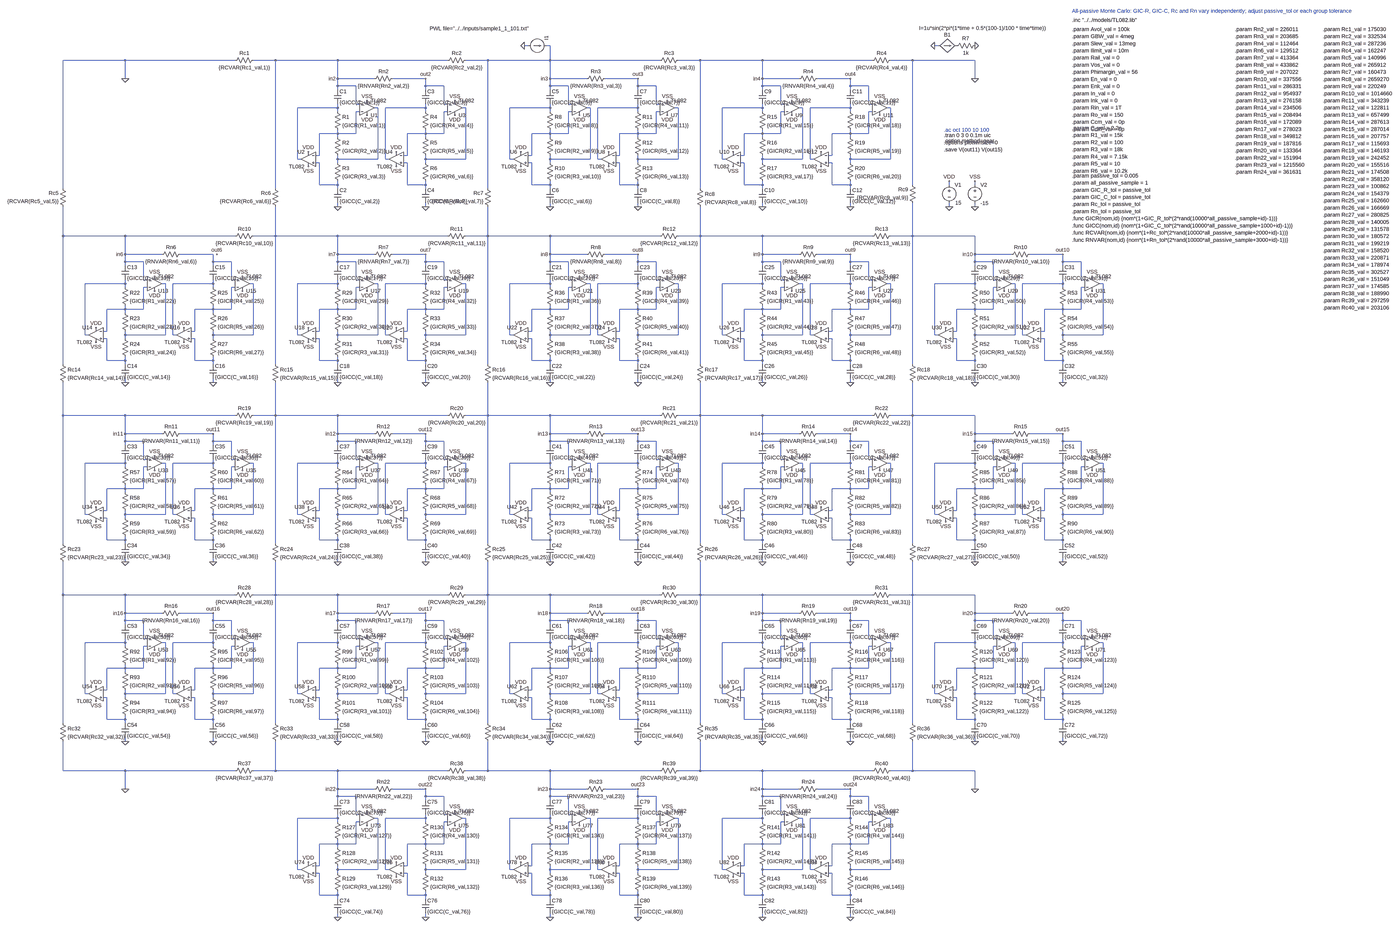
[diagram p0: schematic ALL.asc, whole sheet]
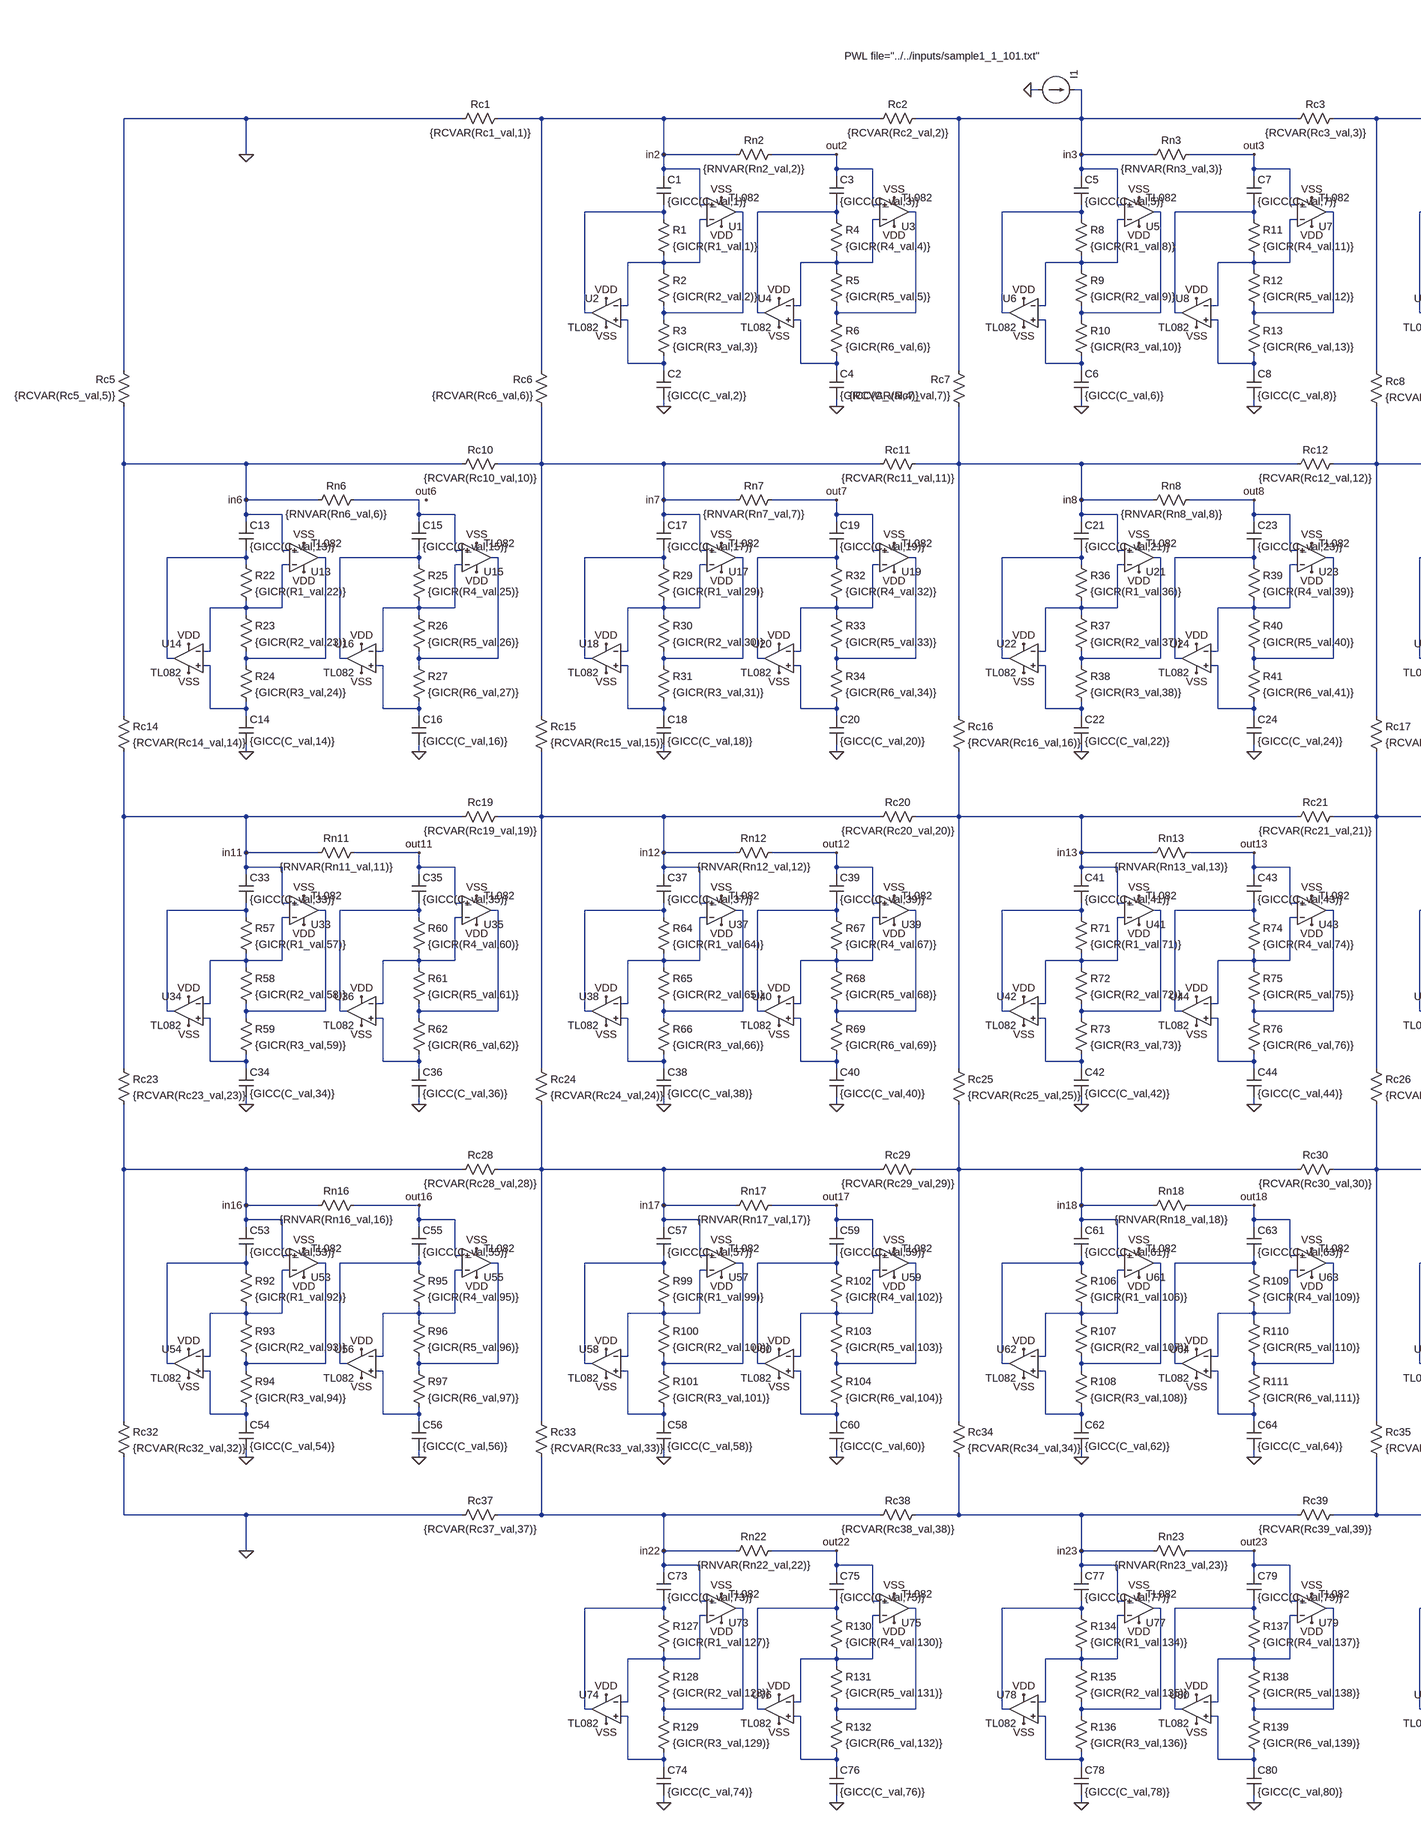
[diagram p1: schematic ALL.asc, part, row 1 of 1, column 1 of 2]
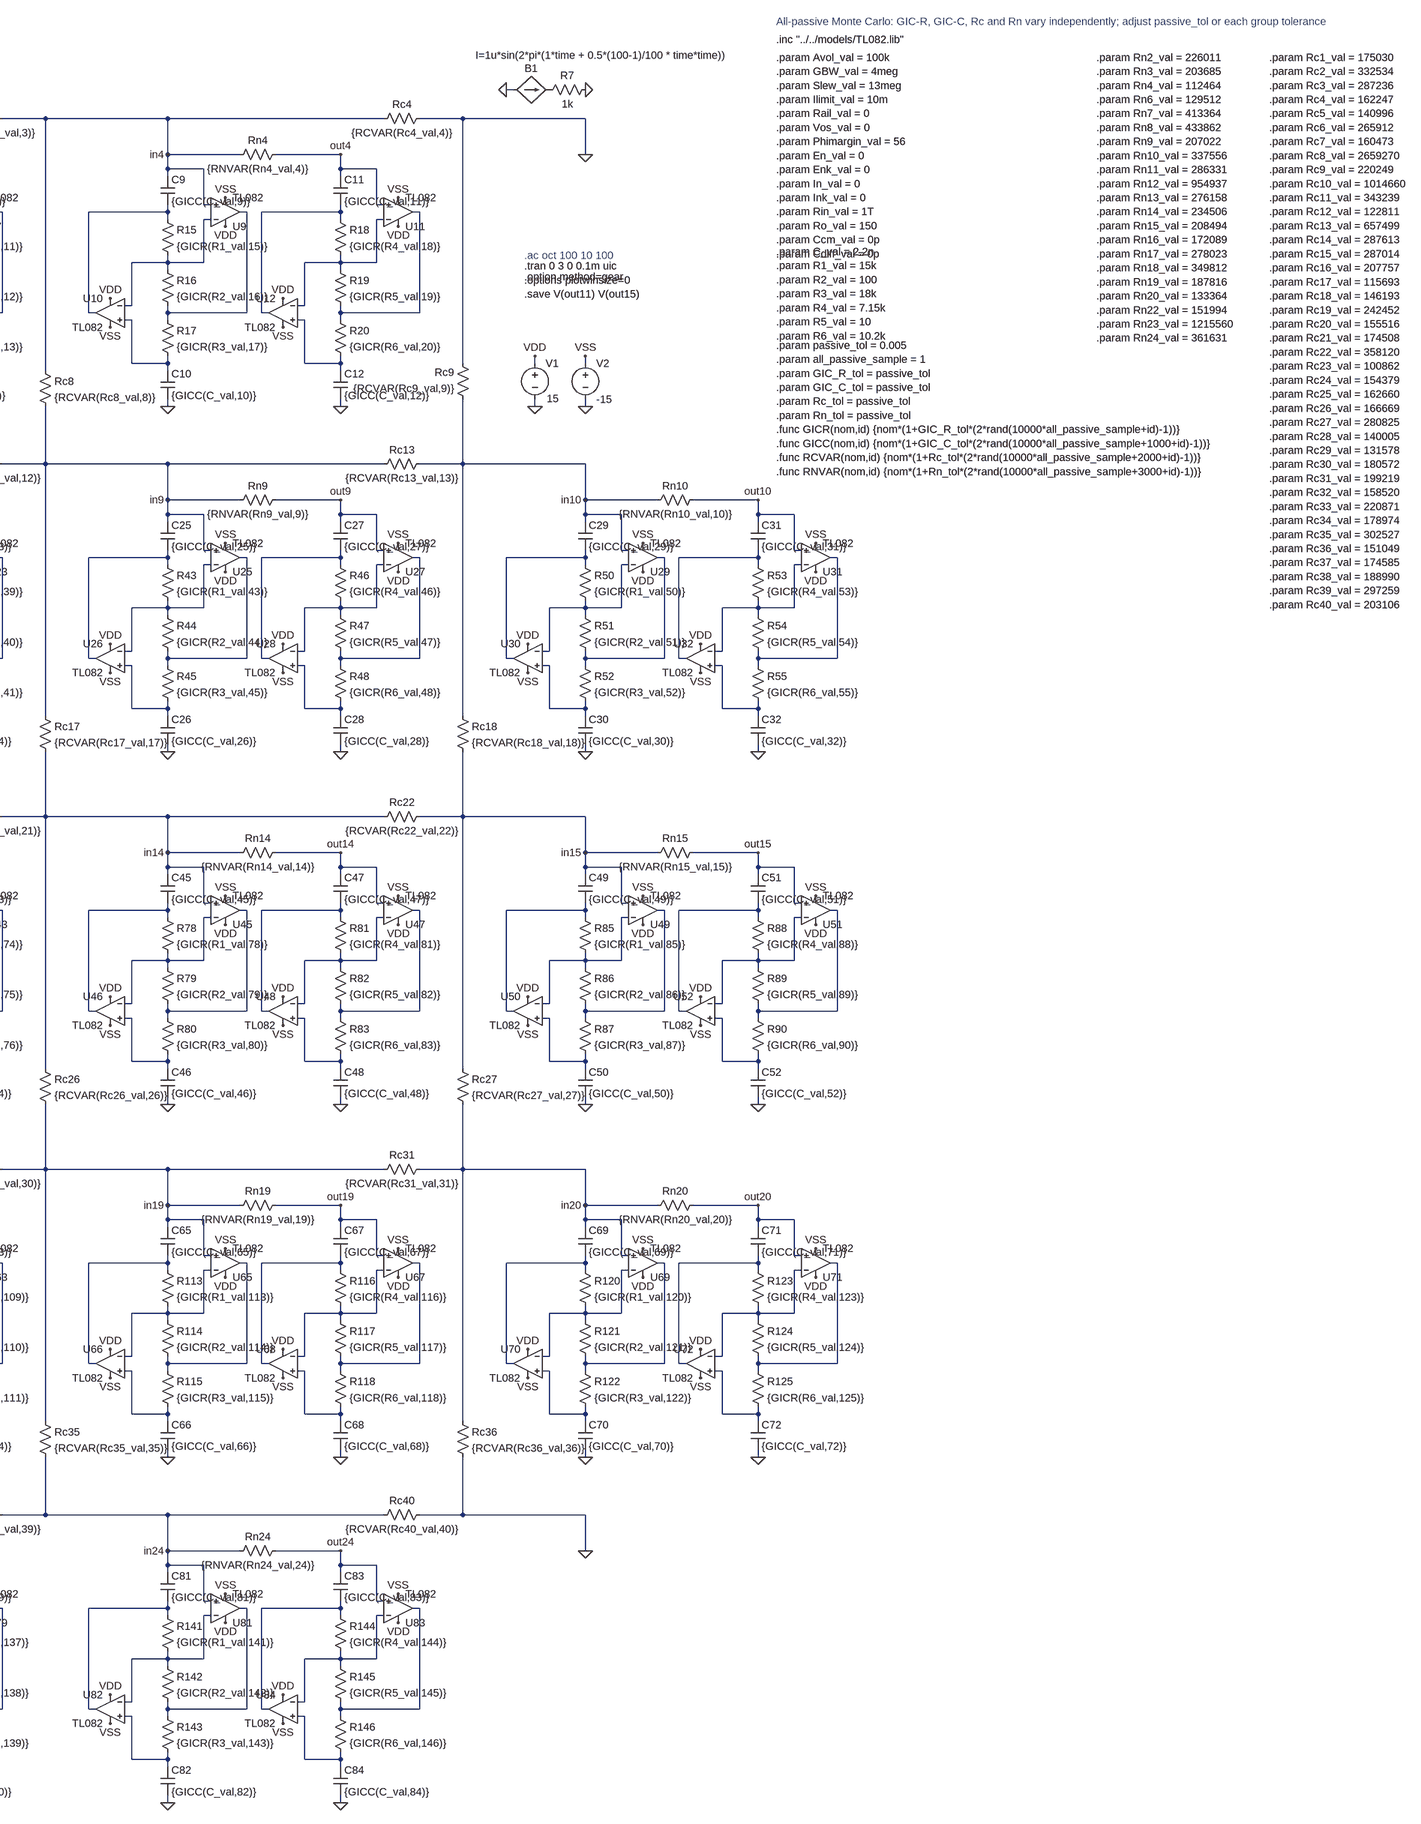
[diagram p2: schematic ALL.asc, part, row 1 of 1, column 2 of 2]
* ALL.asc
V1 VDD 0 15
V2 VSS 0 -15
C1 in2 N001 {GICC(C_val,1)}
R1 N001 N013 {GICR(R1_val,1)}
R2 N013 N002 {GICR(R2_val,2)}
R3 N002 N019 {GICR(R3_val,3)}
C2 N019 0 {GICC(C_val,2)}
C3 out2 N003 {GICC(C_val,3)}
R4 N003 N014 {GICR(R4_val,4)}
R5 N014 N004 {GICR(R5_val,5)}
R6 N004 N020 {GICR(R6_val,6)}
C4 N020 0 {GICC(C_val,4)}
Rn2 out2 in2 {RNVAR(Rn2_val,2)}
C5 in3 N005 {GICC(C_val,5)}
R8 N005 N015 {GICR(R1_val,8)}
R9 N015 N006 {GICR(R2_val,9)}
R10 N006 N021 {GICR(R3_val,10)}
C6 N021 0 {GICC(C_val,6)}
C7 out3 N007 {GICC(C_val,7)}
R11 N007 N016 {GICR(R4_val,11)}
R12 N016 N008 {GICR(R5_val,12)}
R13 N008 N022 {GICR(R6_val,13)}
C8 N022 0 {GICC(C_val,8)}
Rn3 out3 in3 {RNVAR(Rn3_val,3)}
C9 in4 N009 {GICC(C_val,9)}
R15 N009 N017 {GICR(R1_val,15)}
R16 N017 N010 {GICR(R2_val,16)}
R17 N010 N023 {GICR(R3_val,17)}
C10 N023 0 {GICC(C_val,10)}
C11 out4 N011 {GICC(C_val,11)}
R18 N011 N018 {GICR(R4_val,18)}
R19 N018 N012 {GICR(R5_val,19)}
R20 N012 N024 {GICR(R6_val,20)}
C12 N024 0 {GICC(C_val,12)}
Rn4 out4 in4 {RNVAR(Rn4_val,4)}
C13 in6 N026 {GICC(C_val,13)}
R22 N026 N046 {GICR(R1_val,22)}
R23 N046 N027 {GICR(R2_val,23)}
R24 N027 N056 {GICR(R3_val,24)}
C14 N056 0 {GICC(C_val,14)}
C15 N025 N028 {GICC(C_val,15)}
R25 N028 N047 {GICR(R4_val,25)}
R26 N047 N029 {GICR(R5_val,26)}
R27 N029 N057 {GICR(R6_val,27)}
C16 N057 0 {GICC(C_val,16)}
Rn6 N025 in6 {RNVAR(Rn6_val,6)}
C17 in7 N030 {GICC(C_val,17)}
R29 N030 N048 {GICR(R1_val,29)}
R30 N048 N031 {GICR(R2_val,30)}
R31 N031 N058 {GICR(R3_val,31)}
C18 N058 0 {GICC(C_val,18)}
C19 out7 N032 {GICC(C_val,19)}
R32 N032 N049 {GICR(R4_val,32)}
R33 N049 N033 {GICR(R5_val,33)}
R34 N033 N059 {GICR(R6_val,34)}
C20 N059 0 {GICC(C_val,20)}
Rn7 out7 in7 {RNVAR(Rn7_val,7)}
C21 in8 N034 {GICC(C_val,21)}
R36 N034 N050 {GICR(R1_val,36)}
R37 N050 N035 {GICR(R2_val,37)}
R38 N035 N060 {GICR(R3_val,38)}
C22 N060 0 {GICC(C_val,22)}
C23 out8 N036 {GICC(C_val,23)}
R39 N036 N051 {GICR(R4_val,39)}
R40 N051 N037 {GICR(R5_val,40)}
R41 N037 N061 {GICR(R6_val,41)}
C24 N061 0 {GICC(C_val,24)}
Rn8 out8 in8 {RNVAR(Rn8_val,8)}
C25 in9 N038 {GICC(C_val,25)}
R43 N038 N052 {GICR(R1_val,43)}
R44 N052 N039 {GICR(R2_val,44)}
R45 N039 N062 {GICR(R3_val,45)}
C26 N062 0 {GICC(C_val,26)}
C27 out9 N040 {GICC(C_val,27)}
R46 N040 N053 {GICR(R4_val,46)}
R47 N053 N041 {GICR(R5_val,47)}
R48 N041 N063 {GICR(R6_val,48)}
C28 N063 0 {GICC(C_val,28)}
Rn9 out9 in9 {RNVAR(Rn9_val,9)}
C29 in10 N042 {GICC(C_val,29)}
R50 N042 N054 {GICR(R1_val,50)}
R51 N054 N043 {GICR(R2_val,51)}
R52 N043 N064 {GICR(R3_val,52)}
C30 N064 0 {GICC(C_val,30)}
C31 out10 N044 {GICC(C_val,31)}
R53 N044 N055 {GICR(R4_val,53)}
R54 N055 N045 {GICR(R5_val,54)}
R55 N045 N065 {GICR(R6_val,55)}
C32 N065 0 {GICC(C_val,32)}
Rn10 out10 in10 {RNVAR(Rn10_val,10)}
C33 in11 N066 {GICC(C_val,33)}
R57 N066 N086 {GICR(R1_val,57)}
R58 N086 N067 {GICR(R2_val,58)}
R59 N067 N096 {GICR(R3_val,59)}
C34 N096 0 {GICC(C_val,34)}
C35 out11 N068 {GICC(C_val,35)}
R60 N068 N087 {GICR(R4_val,60)}
R61 N087 N069 {GICR(R5_val,61)}
R62 N069 N097 {GICR(R6_val,62)}
C36 N097 0 {GICC(C_val,36)}
Rn11 out11 in11 {RNVAR(Rn11_val,11)}
C37 in12 N070 {GICC(C_val,37)}
R64 N070 N088 {GICR(R1_val,64)}
R65 N088 N071 {GICR(R2_val,65)}
R66 N071 N098 {GICR(R3_val,66)}
C38 N098 0 {GICC(C_val,38)}
C39 out12 N072 {GICC(C_val,39)}
R67 N072 N089 {GICR(R4_val,67)}
R68 N089 N073 {GICR(R5_val,68)}
R69 N073 N099 {GICR(R6_val,69)}
C40 N099 0 {GICC(C_val,40)}
Rn12 out12 in12 {RNVAR(Rn12_val,12)}
C41 in13 N074 {GICC(C_val,41)}
R71 N074 N090 {GICR(R1_val,71)}
R72 N090 N075 {GICR(R2_val,72)}
R73 N075 N100 {GICR(R3_val,73)}
C42 N100 0 {GICC(C_val,42)}
C43 out13 N076 {GICC(C_val,43)}
R74 N076 N091 {GICR(R4_val,74)}
R75 N091 N077 {GICR(R5_val,75)}
R76 N077 N101 {GICR(R6_val,76)}
C44 N101 0 {GICC(C_val,44)}
Rn13 out13 in13 {RNVAR(Rn13_val,13)}
C45 in14 N078 {GICC(C_val,45)}
R78 N078 N092 {GICR(R1_val,78)}
R79 N092 N079 {GICR(R2_val,79)}
R80 N079 N102 {GICR(R3_val,80)}
C46 N102 0 {GICC(C_val,46)}
C47 out14 N080 {GICC(C_val,47)}
R81 N080 N093 {GICR(R4_val,81)}
R82 N093 N081 {GICR(R5_val,82)}
R83 N081 N103 {GICR(R6_val,83)}
C48 N103 0 {GICC(C_val,48)}
Rn14 out14 in14 {RNVAR(Rn14_val,14)}
C49 in15 N082 {GICC(C_val,49)}
R85 N082 N094 {GICR(R1_val,85)}
R86 N094 N083 {GICR(R2_val,86)}
R87 N083 N104 {GICR(R3_val,87)}
C50 N104 0 {GICC(C_val,50)}
C51 out15 N084 {GICC(C_val,51)}
R88 N084 N095 {GICR(R4_val,88)}
R89 N095 N085 {GICR(R5_val,89)}
R90 N085 N105 {GICR(R6_val,90)}
C52 N105 0 {GICC(C_val,52)}
Rn15 out15 in15 {RNVAR(Rn15_val,15)}
C53 in16 N106 {GICC(C_val,53)}
R92 N106 N126 {GICR(R1_val,92)}
R93 N126 N107 {GICR(R2_val,93)}
R94 N107 N136 {GICR(R3_val,94)}
C54 N136 0 {GICC(C_val,54)}
C55 out16 N108 {GICC(C_val,55)}
R95 N108 N127 {GICR(R4_val,95)}
R96 N127 N109 {GICR(R5_val,96)}
R97 N109 N137 {GICR(R6_val,97)}
C56 N137 0 {GICC(C_val,56)}
Rn16 out16 in16 {RNVAR(Rn16_val,16)}
C57 in17 N110 {GICC(C_val,57)}
R99 N110 N128 {GICR(R1_val,99)}
R100 N128 N111 {GICR(R2_val,100)}
R101 N111 N138 {GICR(R3_val,101)}
C58 N138 0 {GICC(C_val,58)}
C59 out17 N112 {GICC(C_val,59)}
R102 N112 N129 {GICR(R4_val,102)}
R103 N129 N113 {GICR(R5_val,103)}
R104 N113 N139 {GICR(R6_val,104)}
C60 N139 0 {GICC(C_val,60)}
Rn17 out17 in17 {RNVAR(Rn17_val,17)}
C61 in18 N114 {GICC(C_val,61)}
R106 N114 N130 {GICR(R1_val,106)}
R107 N130 N115 {GICR(R2_val,107)}
R108 N115 N140 {GICR(R3_val,108)}
C62 N140 0 {GICC(C_val,62)}
C63 out18 N116 {GICC(C_val,63)}
R109 N116 N131 {GICR(R4_val,109)}
R110 N131 N117 {GICR(R5_val,110)}
R111 N117 N141 {GICR(R6_val,111)}
C64 N141 0 {GICC(C_val,64)}
Rn18 out18 in18 {RNVAR(Rn18_val,18)}
C65 in19 N118 {GICC(C_val,65)}
R113 N118 N132 {GICR(R1_val,113)}
R114 N132 N119 {GICR(R2_val,114)}
R115 N119 N142 {GICR(R3_val,115)}
C66 N142 0 {GICC(C_val,66)}
C67 out19 N120 {GICC(C_val,67)}
R116 N120 N133 {GICR(R4_val,116)}
R117 N133 N121 {GICR(R5_val,117)}
R118 N121 N143 {GICR(R6_val,118)}
C68 N143 0 {GICC(C_val,68)}
Rn19 out19 in19 {RNVAR(Rn19_val,19)}
C69 in20 N122 {GICC(C_val,69)}
R120 N122 N134 {GICR(R1_val,120)}
R121 N134 N123 {GICR(R2_val,121)}
R122 N123 N144 {GICR(R3_val,122)}
C70 N144 0 {GICC(C_val,70)}
C71 out20 N124 {GICC(C_val,71)}
R123 N124 N135 {GICR(R4_val,123)}
R124 N135 N125 {GICR(R5_val,124)}
R125 N125 N145 {GICR(R6_val,125)}
C72 N145 0 {GICC(C_val,72)}
Rn20 out20 in20 {RNVAR(Rn20_val,20)}
C73 in22 N146 {GICC(C_val,73)}
R127 N146 N158 {GICR(R1_val,127)}
R128 N158 N147 {GICR(R2_val,128)}
R129 N147 N164 {GICR(R3_val,129)}
C74 N164 0 {GICC(C_val,74)}
C75 out22 N148 {GICC(C_val,75)}
R130 N148 N159 {GICR(R4_val,130)}
R131 N159 N149 {GICR(R5_val,131)}
R132 N149 N165 {GICR(R6_val,132)}
C76 N165 0 {GICC(C_val,76)}
Rn22 out22 in22 {RNVAR(Rn22_val,22)}
C77 in23 N150 {GICC(C_val,77)}
R134 N150 N160 {GICR(R1_val,134)}
R135 N160 N151 {GICR(R2_val,135)}
R136 N151 N166 {GICR(R3_val,136)}
C78 N166 0 {GICC(C_val,78)}
C79 out23 N152 {GICC(C_val,79)}
R137 N152 N161 {GICR(R4_val,137)}
R138 N161 N153 {GICR(R5_val,138)}
R139 N153 N167 {GICR(R6_val,139)}
C80 N167 0 {GICC(C_val,80)}
Rn23 out23 in23 {RNVAR(Rn23_val,23)}
C81 in24 N154 {GICC(C_val,81)}
R141 N154 N162 {GICR(R1_val,141)}
R142 N162 N155 {GICR(R2_val,142)}
R143 N155 N168 {GICR(R3_val,143)}
C82 N168 0 {GICC(C_val,82)}
C83 out24 N156 {GICC(C_val,83)}
R144 N156 N163 {GICR(R4_val,144)}
R145 N163 N157 {GICR(R5_val,145)}
R146 N157 N169 {GICR(R6_val,146)}
C84 N169 0 {GICC(C_val,84)}
Rn24 out24 in24 {RNVAR(Rn24_val,24)}
Rc2 in3 in2 {RCVAR(Rc2_val,2)}
Rc3 in4 in3 {RCVAR(Rc3_val,3)}
Rc6 in7 in2 {RCVAR(Rc6_val,6)}
Rc7 in8 in3 {RCVAR(Rc7_val,7)}
Rc11 in7 in8 {RCVAR(Rc11_val,11)}
Rc12 in8 in9 {RCVAR(Rc12_val,12)}
Rc13 in9 in10 {RCVAR(Rc13_val,13)}
Rc14 in6 in11 {RCVAR(Rc14_val,14)}
Rc15 in7 in12 {RCVAR(Rc15_val,15)}
Rc16 in8 in13 {RCVAR(Rc16_val,16)}
Rc18 in10 in15 {RCVAR(Rc18_val,18)}
Rc21 in14 in13 {RCVAR(Rc21_val,21)}
Rc22 in15 in14 {RCVAR(Rc22_val,22)}
Rc23 in11 in16 {RCVAR(Rc23_val,23)}
Rc24 in12 in17 {RCVAR(Rc24_val,24)}
Rc25 in13 in18 {RCVAR(Rc25_val,25)}
Rc26 in14 in19 {RCVAR(Rc26_val,26)}
Rc27 in15 in20 {RCVAR(Rc27_val,27)}
Rc28 in17 in16 {RCVAR(Rc28_val,28)}
Rc30 in19 in18 {RCVAR(Rc30_val,30)}
Rc32 in16 0 {RCVAR(Rc32_val,32)}
Rc33 in17 in22 {RCVAR(Rc33_val,33)}
Rc34 in18 in23 {RCVAR(Rc34_val,34)}
Rc35 in19 in24 {RCVAR(Rc35_val,35)}
Rc36 in20 0 {RCVAR(Rc36_val,36)}
Rc1 in2 0 {RCVAR(Rc1_val,1)}
Rc5 in6 0 {RCVAR(Rc5_val,5)}
Rc9 in10 0 {RCVAR(Rc9_val,9)}
Rc4 in4 0 {RCVAR(Rc4_val,4)}
Rc37 in22 0 {RCVAR(Rc37_val,37)}
Rc38 in23 in22 {RCVAR(Rc38_val,38)}
Rc39 in24 in23 {RCVAR(Rc39_val,39)}
Rc40 0 in24 {RCVAR(Rc40_val,40)}
R7 0 P001 1k
B1 0 P001 I=1u*sin(2*pi*(1*time + 0.5*(100-1)/100 * time*time))
I1 0 in3 PWL file="../../inputs/sample1_1_101.txt"
X§U1 in2 N013 VDD VSS N002 TL082  ; pins In+ In- V+ V- OUT
X§U2 N019 N013 VDD VSS N001 TL082  ; pins In+ In- V+ V- OUT
X§U3 out2 N014 VDD VSS N004 TL082  ; pins In+ In- V+ V- OUT
X§U4 N020 N014 VDD VSS N003 TL082  ; pins In+ In- V+ V- OUT
X§U5 in3 N015 VDD VSS N006 TL082  ; pins In+ In- V+ V- OUT
X§U6 N021 N015 VDD VSS N005 TL082  ; pins In+ In- V+ V- OUT
X§U7 out3 N016 VDD VSS N008 TL082  ; pins In+ In- V+ V- OUT
X§U8 N022 N016 VDD VSS N007 TL082  ; pins In+ In- V+ V- OUT
X§U9 in4 N017 VDD VSS N010 TL082  ; pins In+ In- V+ V- OUT
X§U10 N023 N017 VDD VSS N009 TL082  ; pins In+ In- V+ V- OUT
X§U11 out4 N018 VDD VSS N012 TL082  ; pins In+ In- V+ V- OUT
X§U12 N024 N018 VDD VSS N011 TL082  ; pins In+ In- V+ V- OUT
X§U13 in6 N046 VDD VSS N027 TL082  ; pins In+ In- V+ V- OUT
X§U14 N056 N046 VDD VSS N026 TL082  ; pins In+ In- V+ V- OUT
X§U15 N025 N047 VDD VSS N029 TL082  ; pins In+ In- V+ V- OUT
X§U16 N057 N047 VDD VSS N028 TL082  ; pins In+ In- V+ V- OUT
X§U17 in7 N048 VDD VSS N031 TL082  ; pins In+ In- V+ V- OUT
X§U18 N058 N048 VDD VSS N030 TL082  ; pins In+ In- V+ V- OUT
X§U19 out7 N049 VDD VSS N033 TL082  ; pins In+ In- V+ V- OUT
X§U20 N059 N049 VDD VSS N032 TL082  ; pins In+ In- V+ V- OUT
X§U21 in8 N050 VDD VSS N035 TL082  ; pins In+ In- V+ V- OUT
X§U22 N060 N050 VDD VSS N034 TL082  ; pins In+ In- V+ V- OUT
X§U23 out8 N051 VDD VSS N037 TL082  ; pins In+ In- V+ V- OUT
X§U24 N061 N051 VDD VSS N036 TL082  ; pins In+ In- V+ V- OUT
X§U25 in9 N052 VDD VSS N039 TL082  ; pins In+ In- V+ V- OUT
X§U26 N062 N052 VDD VSS N038 TL082  ; pins In+ In- V+ V- OUT
X§U27 out9 N053 VDD VSS N041 TL082  ; pins In+ In- V+ V- OUT
X§U28 N063 N053 VDD VSS N040 TL082  ; pins In+ In- V+ V- OUT
X§U29 in10 N054 VDD VSS N043 TL082  ; pins In+ In- V+ V- OUT
X§U30 N064 N054 VDD VSS N042 TL082  ; pins In+ In- V+ V- OUT
X§U31 out10 N055 VDD VSS N045 TL082  ; pins In+ In- V+ V- OUT
X§U32 N065 N055 VDD VSS N044 TL082  ; pins In+ In- V+ V- OUT
X§U33 in11 N086 VDD VSS N067 TL082  ; pins In+ In- V+ V- OUT
X§U34 N096 N086 VDD VSS N066 TL082  ; pins In+ In- V+ V- OUT
X§U35 out11 N087 VDD VSS N069 TL082  ; pins In+ In- V+ V- OUT
X§U36 N097 N087 VDD VSS N068 TL082  ; pins In+ In- V+ V- OUT
X§U37 in12 N088 VDD VSS N071 TL082  ; pins In+ In- V+ V- OUT
X§U38 N098 N088 VDD VSS N070 TL082  ; pins In+ In- V+ V- OUT
X§U39 out12 N089 VDD VSS N073 TL082  ; pins In+ In- V+ V- OUT
X§U40 N099 N089 VDD VSS N072 TL082  ; pins In+ In- V+ V- OUT
X§U41 in13 N090 VDD VSS N075 TL082  ; pins In+ In- V+ V- OUT
X§U42 N100 N090 VDD VSS N074 TL082  ; pins In+ In- V+ V- OUT
X§U43 out13 N091 VDD VSS N077 TL082  ; pins In+ In- V+ V- OUT
X§U44 N101 N091 VDD VSS N076 TL082  ; pins In+ In- V+ V- OUT
X§U45 in14 N092 VDD VSS N079 TL082  ; pins In+ In- V+ V- OUT
X§U46 N102 N092 VDD VSS N078 TL082  ; pins In+ In- V+ V- OUT
X§U47 out14 N093 VDD VSS N081 TL082  ; pins In+ In- V+ V- OUT
X§U48 N103 N093 VDD VSS N080 TL082  ; pins In+ In- V+ V- OUT
X§U49 in15 N094 VDD VSS N083 TL082  ; pins In+ In- V+ V- OUT
X§U50 N104 N094 VDD VSS N082 TL082  ; pins In+ In- V+ V- OUT
X§U51 out15 N095 VDD VSS N085 TL082  ; pins In+ In- V+ V- OUT
X§U52 N105 N095 VDD VSS N084 TL082  ; pins In+ In- V+ V- OUT
X§U53 in16 N126 VDD VSS N107 TL082  ; pins In+ In- V+ V- OUT
X§U54 N136 N126 VDD VSS N106 TL082  ; pins In+ In- V+ V- OUT
X§U55 out16 N127 VDD VSS N109 TL082  ; pins In+ In- V+ V- OUT
X§U56 N137 N127 VDD VSS N108 TL082  ; pins In+ In- V+ V- OUT
X§U57 in17 N128 VDD VSS N111 TL082  ; pins In+ In- V+ V- OUT
X§U58 N138 N128 VDD VSS N110 TL082  ; pins In+ In- V+ V- OUT
X§U59 out17 N129 VDD VSS N113 TL082  ; pins In+ In- V+ V- OUT
X§U60 N139 N129 VDD VSS N112 TL082  ; pins In+ In- V+ V- OUT
X§U61 in18 N130 VDD VSS N115 TL082  ; pins In+ In- V+ V- OUT
X§U62 N140 N130 VDD VSS N114 TL082  ; pins In+ In- V+ V- OUT
X§U63 out18 N131 VDD VSS N117 TL082  ; pins In+ In- V+ V- OUT
X§U64 N141 N131 VDD VSS N116 TL082  ; pins In+ In- V+ V- OUT
X§U65 in19 N132 VDD VSS N119 TL082  ; pins In+ In- V+ V- OUT
X§U66 N142 N132 VDD VSS N118 TL082  ; pins In+ In- V+ V- OUT
X§U67 out19 N133 VDD VSS N121 TL082  ; pins In+ In- V+ V- OUT
X§U68 N143 N133 VDD VSS N120 TL082  ; pins In+ In- V+ V- OUT
X§U69 in20 N134 VDD VSS N123 TL082  ; pins In+ In- V+ V- OUT
X§U70 N144 N134 VDD VSS N122 TL082  ; pins In+ In- V+ V- OUT
X§U71 out20 N135 VDD VSS N125 TL082  ; pins In+ In- V+ V- OUT
X§U72 N145 N135 VDD VSS N124 TL082  ; pins In+ In- V+ V- OUT
X§U73 in22 N158 VDD VSS N147 TL082  ; pins In+ In- V+ V- OUT
X§U74 N164 N158 VDD VSS N146 TL082  ; pins In+ In- V+ V- OUT
X§U75 out22 N159 VDD VSS N149 TL082  ; pins In+ In- V+ V- OUT
X§U76 N165 N159 VDD VSS N148 TL082  ; pins In+ In- V+ V- OUT
X§U77 in23 N160 VDD VSS N151 TL082  ; pins In+ In- V+ V- OUT
X§U78 N166 N160 VDD VSS N150 TL082  ; pins In+ In- V+ V- OUT
X§U79 out23 N161 VDD VSS N153 TL082  ; pins In+ In- V+ V- OUT
X§U80 N167 N161 VDD VSS N152 TL082  ; pins In+ In- V+ V- OUT
X§U81 in24 N162 VDD VSS N155 TL082  ; pins In+ In- V+ V- OUT
X§U82 N168 N162 VDD VSS N154 TL082  ; pins In+ In- V+ V- OUT
X§U83 out24 N163 VDD VSS N157 TL082  ; pins In+ In- V+ V- OUT
X§U84 N169 N163 VDD VSS N156 TL082  ; pins In+ In- V+ V- OUT
Rc8 in4 in9 {RCVAR(Rc8_val,8)}
Rc10 in7 in6 {RCVAR(Rc10_val,10)}
Rc17 in9 in14 {RCVAR(Rc17_val,17)}
Rc19 in12 in11 {RCVAR(Rc19_val,19)}
Rc20 in13 in12 {RCVAR(Rc20_val,20)}
Rc29 in18 in17 {RCVAR(Rc29_val,29)}
Rc31 in20 in19 {RCVAR(Rc31_val,31)}
* .ac oct 100 10 100
.tran 0 3 0 0.1m uic
.options plotwinsize=0
.save V(out11) V(out15)
.option method=gear
* All-passive Monte Carlo: GIC-R, GIC-C, Rc and Rn vary independently; adjust passive_tol or each group tolerance
.inc "../../models/TL082.lib"
.param Avol_val = 100k
.param GBW_val = 4meg
.param Slew_val = 13meg
.param Ilimit_val = 10m
.param Rail_val = 0
.param Vos_val = 0
.param Phimargin_val = 56
.param En_val = 0
.param Enk_val = 0
.param In_val = 0
.param Ink_val = 0
.param Rin_val = 1T
.param Ro_val = 150
.param Ccm_val = 0p
.param Cdiff_val = 0p
.param C_val = 2.2n
.param R1_val = 15k
.param R2_val = 100
.param R3_val = 18k
.param R4_val = 7.15k
.param R5_val = 10
.param R6_val = 10.2k
.param Rc1_val = 175030
.param Rc2_val = 332534
.param Rc3_val = 287236
.param Rc4_val = 162247
.param Rc5_val = 140996
.param Rc6_val = 265912
.param Rc7_val = 160473
.param Rc8_val = 2659270
.param Rc9_val = 220249
.param Rc10_val = 1014660
.param Rc11_val = 343239
.param Rc12_val = 122811
.param Rc13_val = 657499
.param Rc14_val = 287613
.param Rc15_val = 287014
.param Rc16_val = 207757
.param Rc17_val = 115693
.param Rc18_val = 146193
.param Rc19_val = 242452
.param Rc20_val = 155516
.param Rc21_val = 174508
.param Rc22_val = 358120
.param Rc23_val = 100862
.param Rc24_val = 154379
.param Rc25_val = 162660
.param Rc26_val = 166669
.param Rc27_val = 280825
.param Rc28_val = 140005
.param Rc29_val = 131578
.param Rc30_val = 180572
.param Rc31_val = 199219
.param Rc32_val = 158520
.param Rc33_val = 220871
.param Rc34_val = 178974
.param Rc35_val = 302527
.param Rc36_val = 151049
.param Rc37_val = 174585
.param Rc38_val = 188990
.param Rc39_val = 297259
.param Rc40_val = 203106
.param Rn2_val = 226011
.param Rn3_val = 203685
.param Rn4_val = 112464
.param Rn6_val = 129512
.param Rn7_val = 413364
.param Rn8_val = 433862
.param Rn9_val = 207022
.param Rn10_val = 337556
.param Rn11_val = 286331
.param Rn12_val = 954937
.param Rn13_val = 276158
.param Rn14_val = 234506
.param Rn15_val = 208494
.param Rn16_val = 172089
.param Rn17_val = 278023
.param Rn18_val = 349812
.param Rn19_val = 187816
.param Rn20_val = 133364
.param Rn22_val = 151994
.param Rn23_val = 1215560
.param Rn24_val = 361631
.param passive_tol = 0.005
.param all_passive_sample = 1
.param GIC_R_tol = passive_tol
.param GIC_C_tol = passive_tol
.param Rc_tol = passive_tol
.param Rn_tol = passive_tol
.func GICR(nom,id) {nom*(1+GIC_R_tol*(2*rand(10000*all_passive_sample+id)-1))}
.func GICC(nom,id) {nom*(1+GIC_C_tol*(2*rand(10000*all_passive_sample+1000+id)-1))}
.func RCVAR(nom,id) {nom*(1+Rc_tol*(2*rand(10000*all_passive_sample+2000+id)-1))}
.func RNVAR(nom,id) {nom*(1+Rn_tol*(2*rand(10000*all_passive_sample+3000+id)-1))}
.backanno
.end